# Altium schematic sheet RS232.SchDoc
size A; SheetNumber: 3; SheetTotal: 7
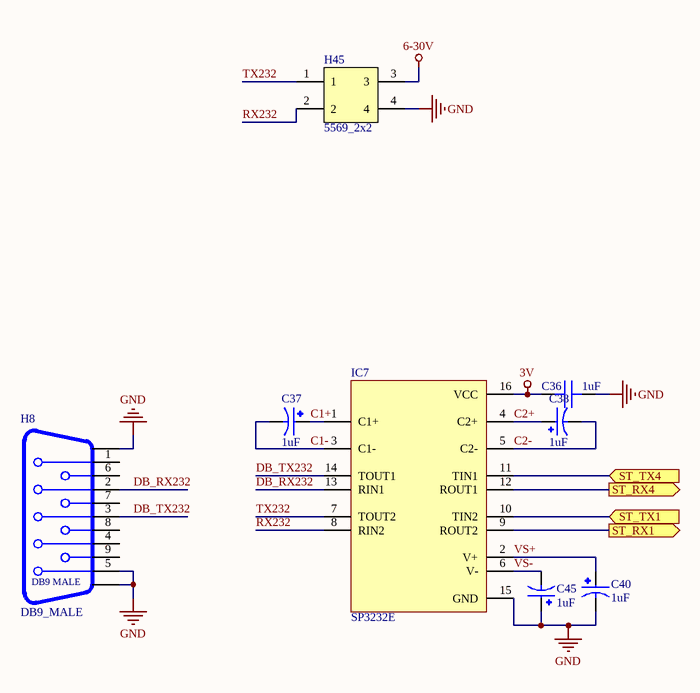
[diagram p0: RS232.SchDoc]

## Parts
C36  1uF  [C0603]
C37  1uF  [1206P]
C38  1uF  [1206P]
C40  1uF  [1206P]
C45  1uF  [1206P]
H8  DB9_MALE  [DB9_MALE]
H45  5569_2x2  [5569_2x2]
IC7  SP3232E  [SSOP-16]

## Ports
ST_RX1 (out, see DeoCaProjectV3.1[2C], MCU[3B]), ST_RX4 (out, see DeoCaProjectV3.1[2C], MCU[3A]), ST_TX1 (in, see DeoCaProjectV3.1[2C], MCU[3B]), ST_TX4 (in, see DeoCaProjectV3.1[2C], MCU[3A])

## Nets
3V: C36.1 IC7.16(VCC)
6-30V: H45.3
GND: C36.2 C40.2 C45.1 H8.5 H8.SHELL(SHIELD) H8.SHELL1(SHIELD) H45.4 IC7.15(GND)
C1+: C37.1 IC7.1(C1+)
C1-: C37.2 IC7.3(C1-)
C2+: C38.1 IC7.4(C2+)
C2-: C38.2 IC7.5(C2-)
DB_RX232: H8.2 IC7.13(RIN1)
DB_TX232: H8.3 IC7.14(TOUT1)
RX232: H45.2 IC7.8(RIN2)
ST_RX1: IC7.9(ROUT2) ; port ST_RX1
ST_RX4: IC7.12(ROUT1) ; port ST_RX4
ST_TX1: IC7.10(TIN2) ; port ST_TX1
ST_TX4: IC7.11(TIN1) ; port ST_TX4
TX232: H45.1 IC7.7(TOUT2)
VS+: C40.1 IC7.2(V+)
VS-: C45.2 IC7.6(V-)

Not connected (* = marked no-connect by the designer): H8 1 4 6 7 8 9

## Notes on the sheet
- (in symbol DB9_MALE) DB9 MALE

## Library data of the parts
C36 = Capacitor
C37 C38 C40 C45 = CAP_TAN_1206: Aluminum Electrolytic Capacitors - Radial Leaded 50VDC 1200uF 10000H 16x25mm; MF: Panasonic; MP: EEU-FS1H122; Price: None; Value: *; Availability: In Stock; Check_prices: https://www.snapeda.com/parts/EEU-FS1H122/Panasonic/view-part/?ref=eda; Purchase-URL: https://pricing.snapeda.com/search/part/EEU-FS1H122/?ref=eda; SnapEDA_Link: https://www.snapeda.com/parts/EEU-FS1H122/Panasonic/view-part/?ref=snap; Package: RADIAL-2 Panasonic
H8 = DB9_MALE: 9 Position D-Sub Receptacle, Female Sockets Connector; MP: 618009233821; MF: Wurth Electronics; Price: None; SnapEDA_Link: https://www.snapeda.com/parts/618009233821/Wurth+Electronics+Inc./view-part/?ref=snap; Purchase-URL: https://pricing.snapeda.com/search/part/618009233821/?ref=eda; Availability: In Stock; Check_prices: https://www.snapeda.com/parts/618009233821/Wurth+Electronics+Inc./view-part/?ref=eda; Value: *; Package: None
IC7 = SP3232E: 3-V to 5.5-V multichannel RS-232 line driver & receiver 16-SOIC -40 to 85; MP: MAX3232IDR; MF: Texas Instruments; Check_prices: https://www.snapeda.com/parts/MAX3232IDR/Texas%20Instruments/view-part/559735/?ref=eda; Value: *; Package: SOIC-16 Texas Instruments; Purchase-URL: https://pricing.snapeda.com/search/part/MAX3232IDR/?ref=eda; SnapEDA_Link: https://www.snapeda.com/parts/MAX3232IDR/Texas%20Instruments/view-part/559735/?ref=snap; Digi-Key_Part_Number: 296-13098-1-ND